# EasyEDA Pro project Midal-MIDI-Interface_2025-12-06.epro

# Schematic Core board

## Sheets
1 MC: Board Name: Core board; Create Date: 2025-09-05; Page Name: MC; Project Name: Midal MIDI Interface; Schematic Name: Core board; Update Date: 2025-10-09; Company: EasyEDA.com; Page Size: A4; Version: V1.0
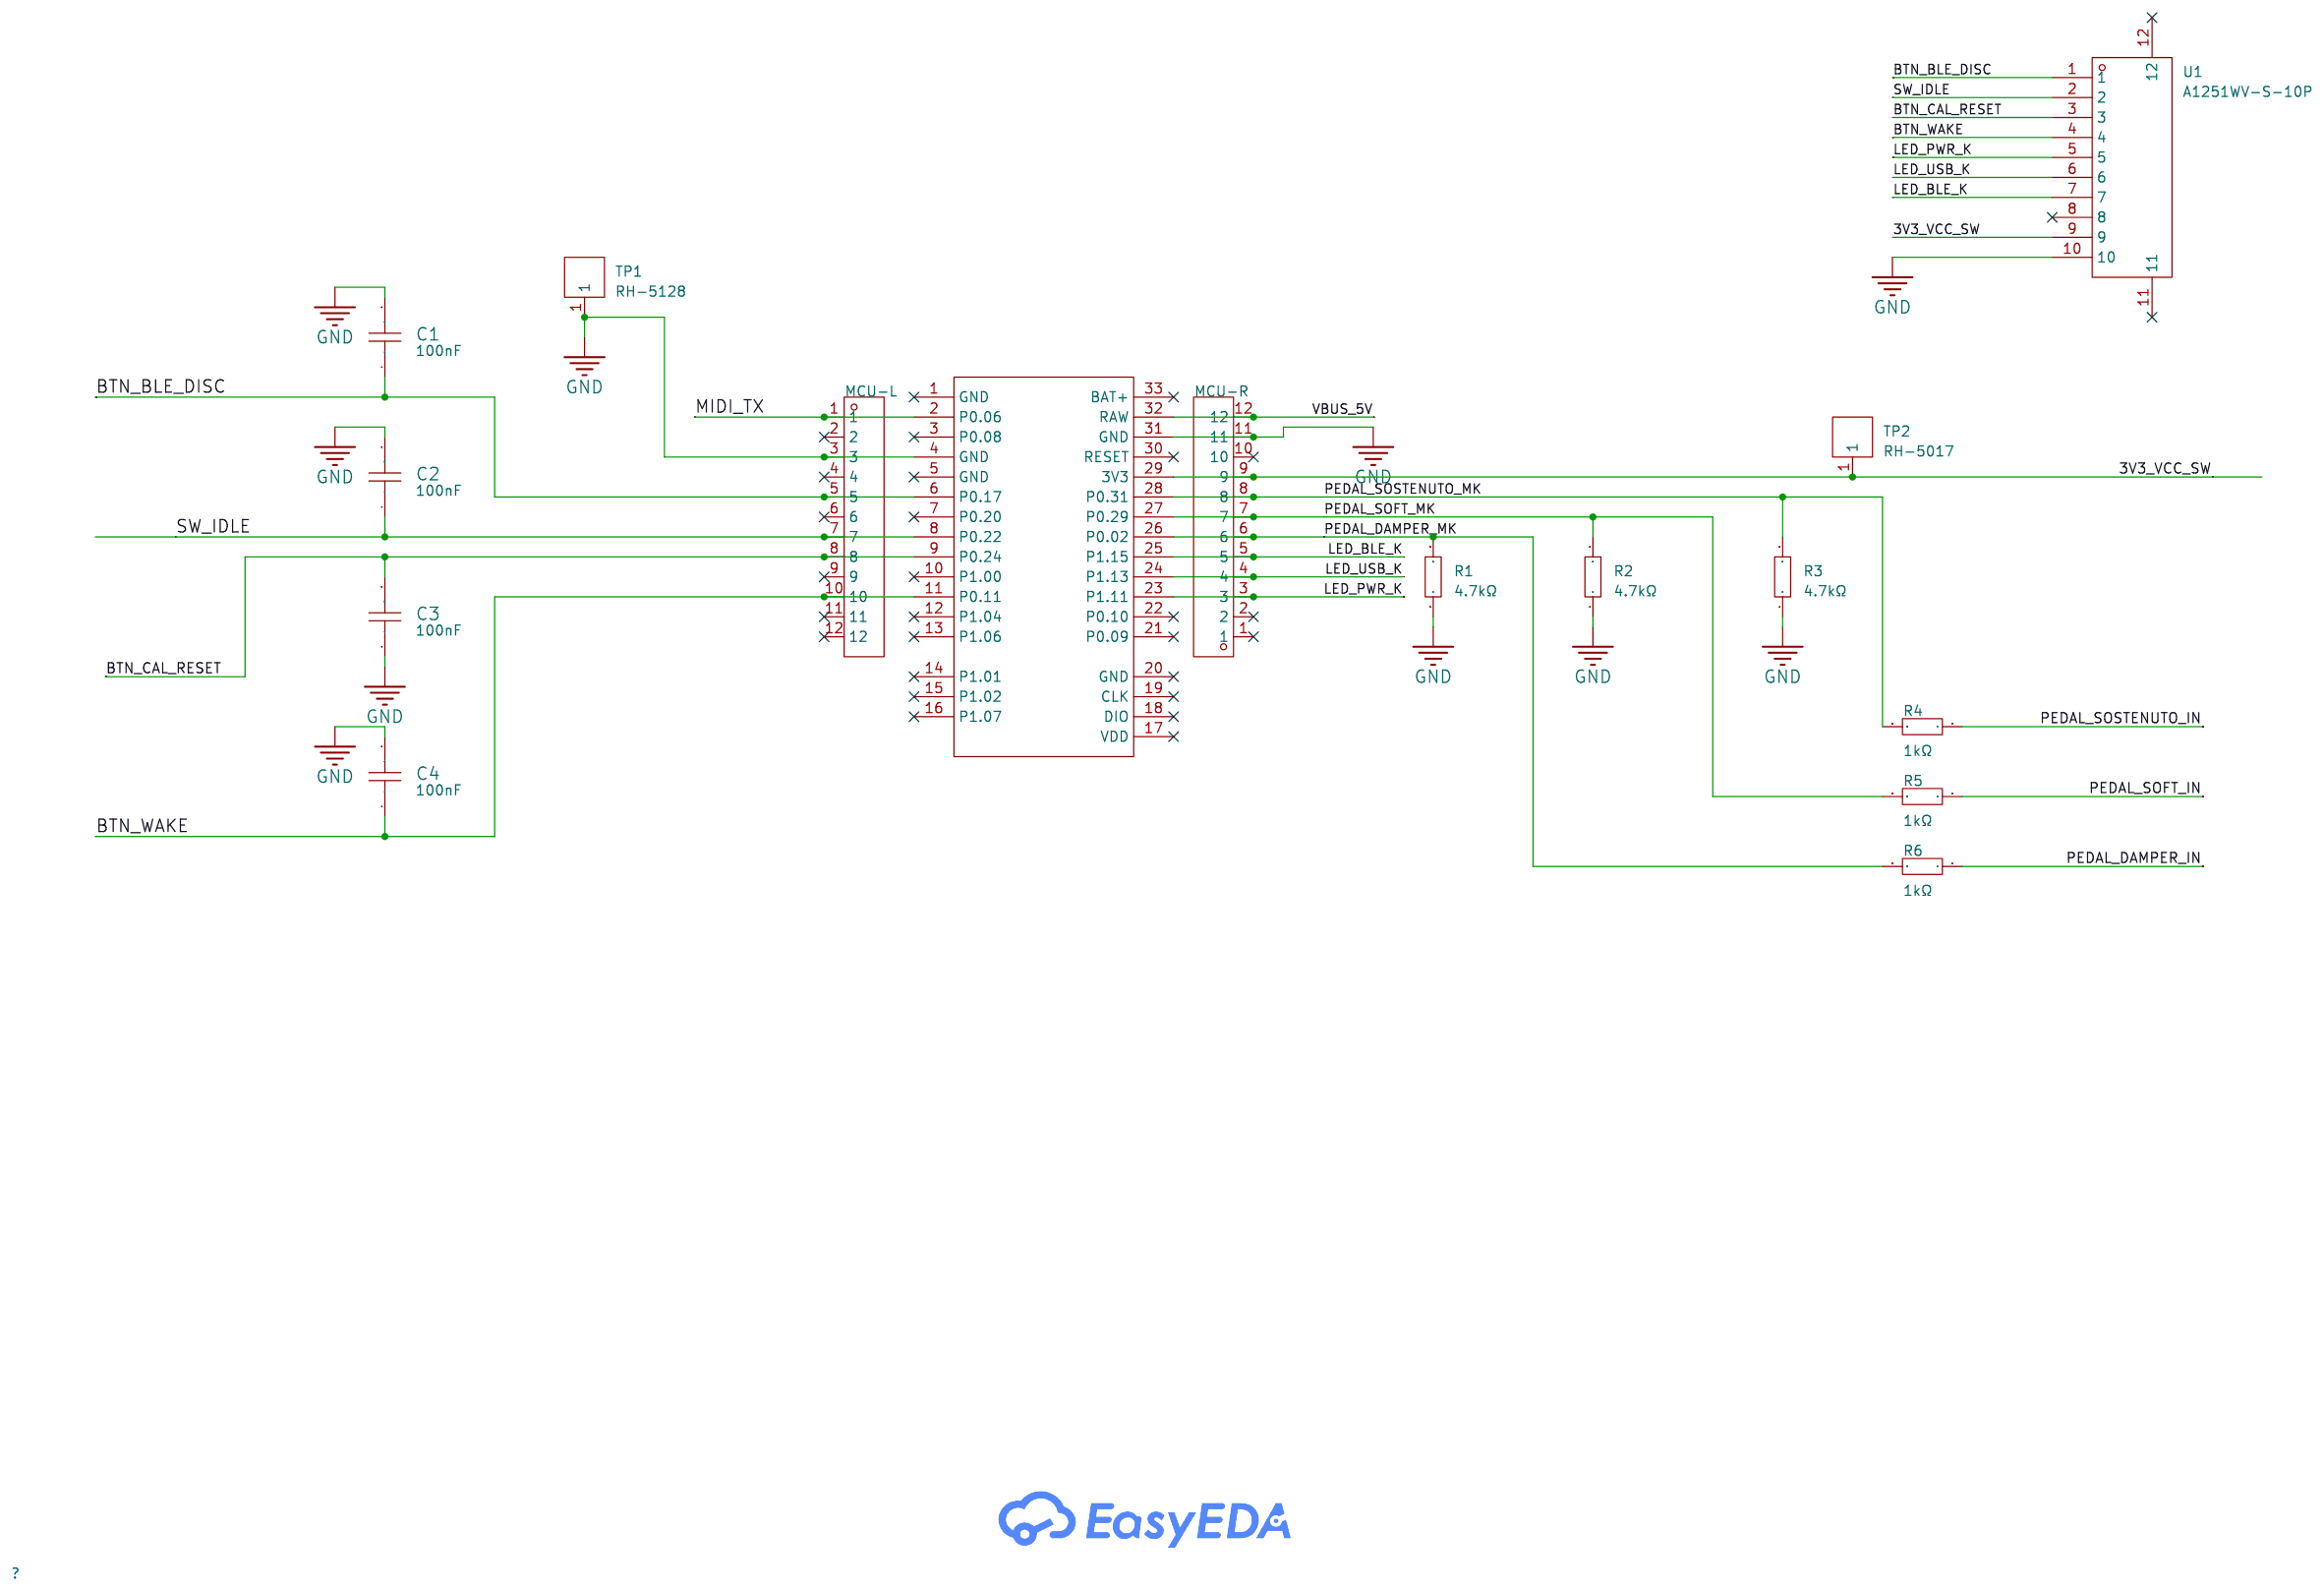
[diagram p0: MC]
2 PEDAL: Page Name: PEDAL; Update Date: 2025-10-07
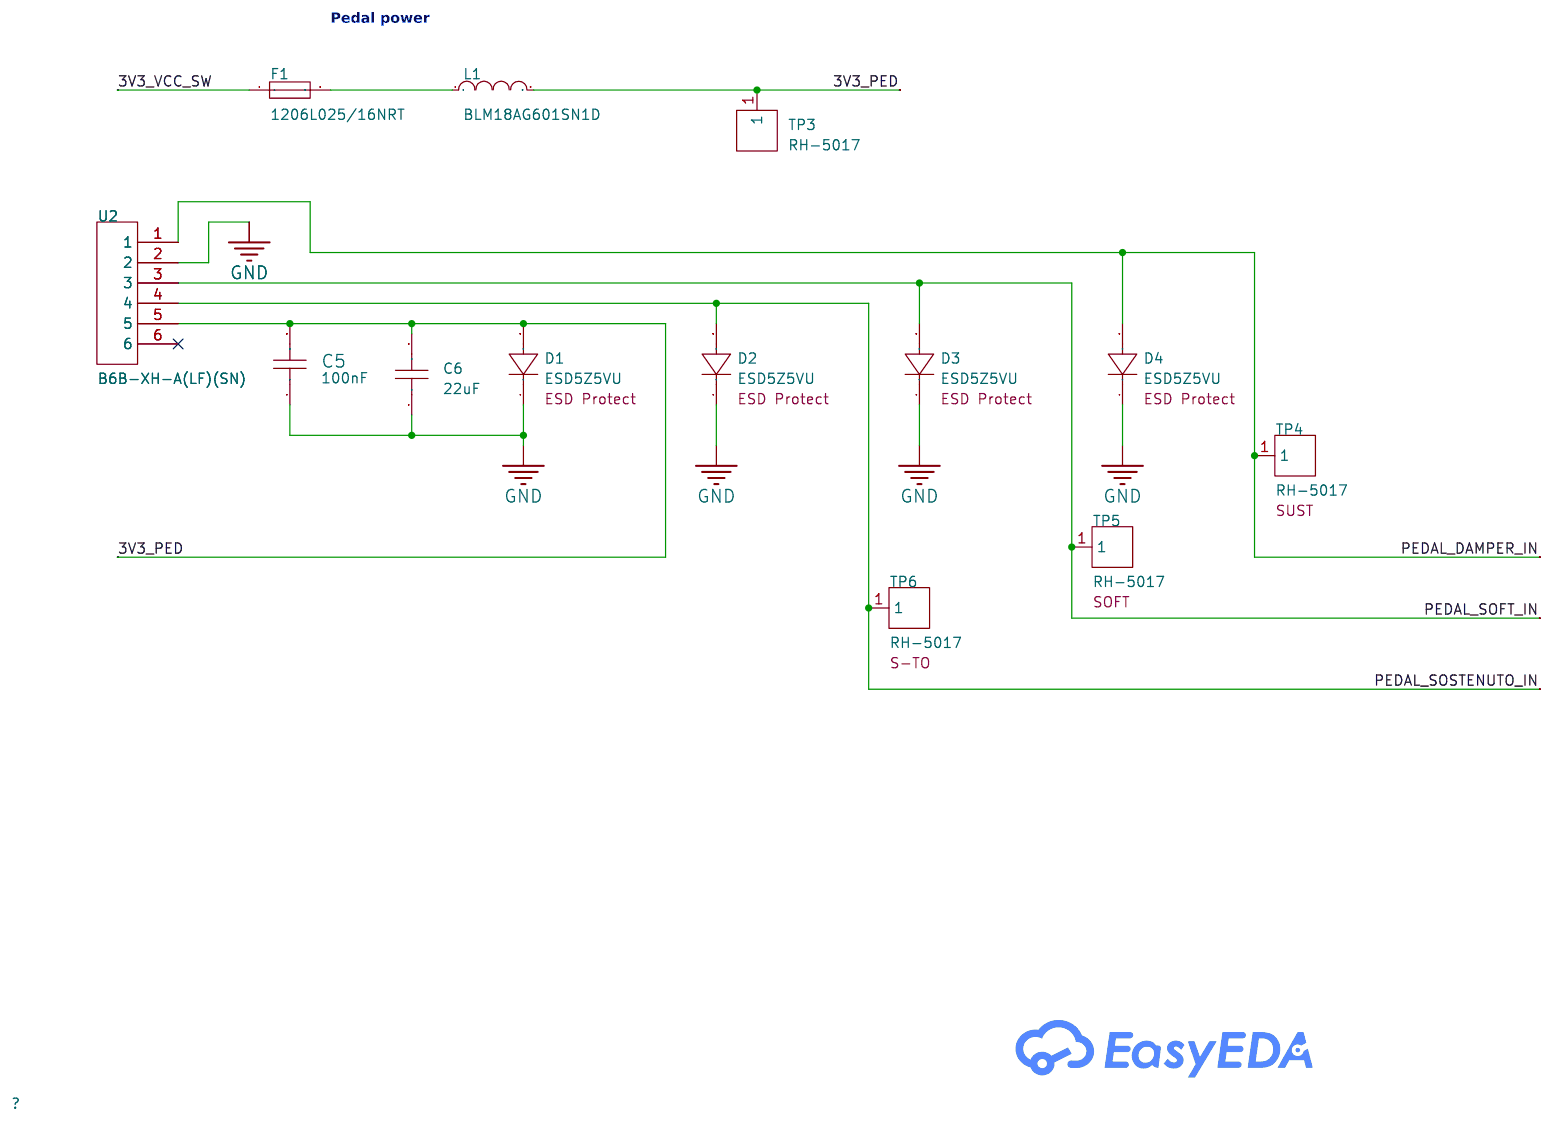
[diagram p1: PEDAL]
3 MIDI OUT: Page Name: MIDI OUT; Update Date: 2025-10-08
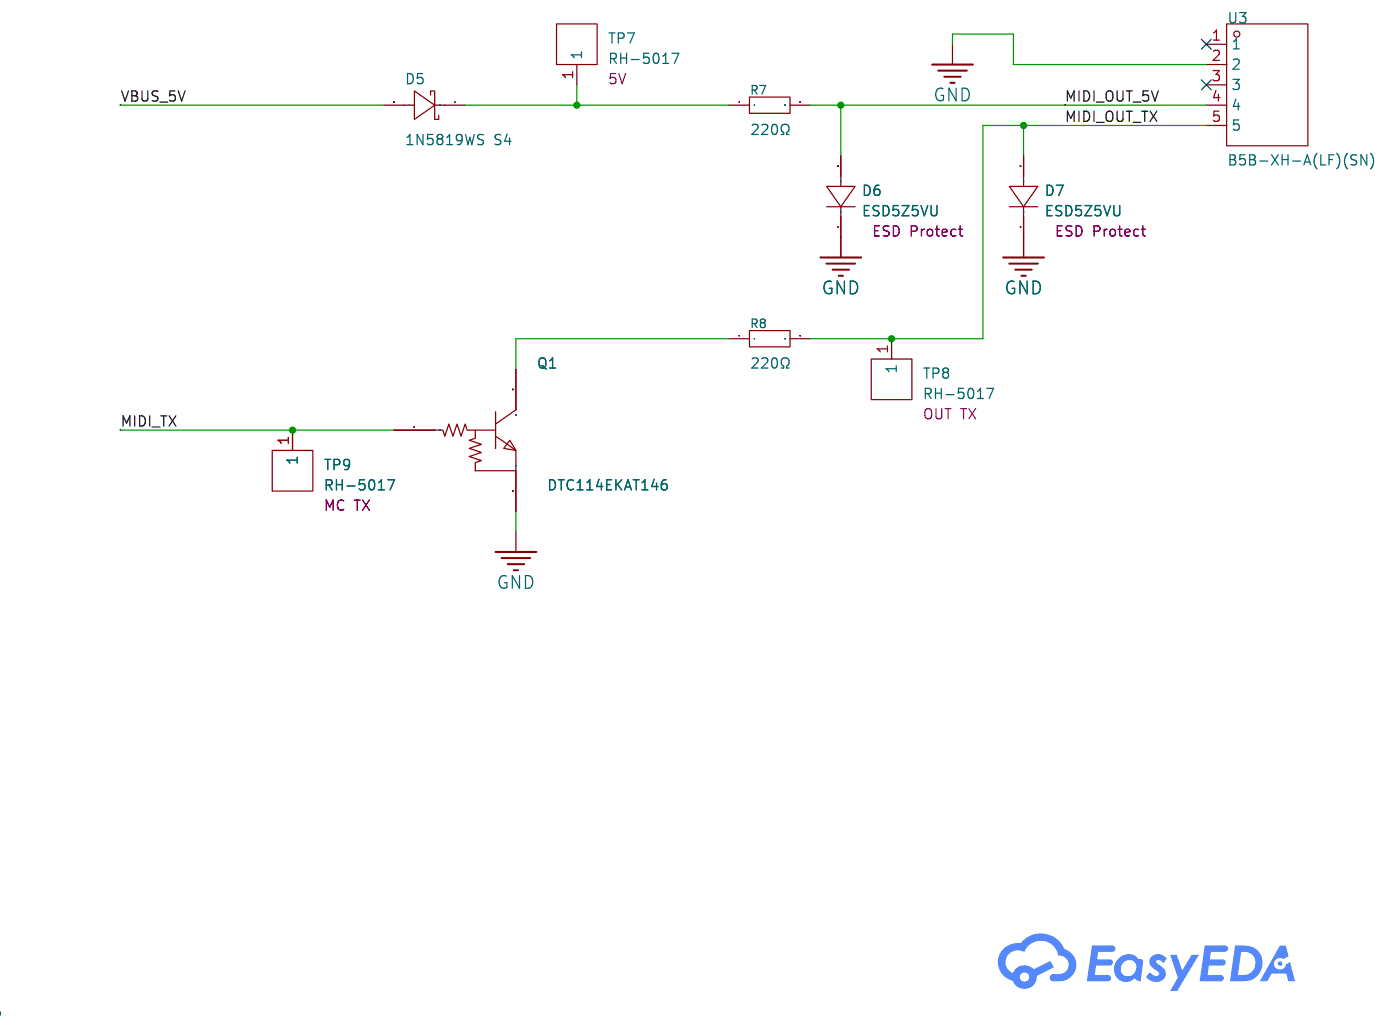
[diagram p2: MIDI OUT]

## Parts
sheet MC
C1  100nF  [C0603]
C2  100nF  [C0603]
C3  100nF  [C0603]
C4  100nF  [C0603]
MCU1  a04b0b1ddfb941d7a6903b0407237df4  [Pro Micro nRF52840]  (no BOM)
MCU-L  PM254-1-12-Z-3.0-C  [HDR-TH_12P-P2.54-V-F-3]
MCU-R  PM254-1-12-Z-3.0-C  [HDR-TH_12P-P2.54-V-F-3]
R1  4.7kΩ  [R0603]
R2  4.7kΩ  [R0603]
R3  4.7kΩ  [R0603]
R4  1kΩ  [R0603]
R5  1kΩ  [R0603]
R6  1kΩ  [R0603]
TP1  RH-5128  [TH_BD3.2-D2.0]
TP2  RH-5017  [SMD_L2.7-W1.0]  (no BOM)
U1  A1251WV-S-10P  [CONN-SMD_10P-P1.25_A1251WV-S-10P]
sheet MIDI OUT
D5  1N5819WS S4  [SOD-323_L1.6-W1.3-LS2.7-RD]
D6  ESD5Z5VU  [SOD-523_L1.2-W0.8-LS1.6-RD]
D7  ESD5Z5VU  [SOD-523_L1.2-W0.8-LS1.6-RD]
Q1  DTC114EKAT146  [SOT-346_L2.9-W1.6-P1.90-LS2.8-TR-CW]
R7  220Ω  [R0603]
R8  220Ω  [R0603]
TP7  RH-5017  [SMD_L2.7-W1.0]  (no BOM)
TP8  RH-5017  [SMD_L2.7-W1.0]  (no BOM)
TP9  RH-5017  [SMD_L2.7-W1.0]  (no BOM)
U3  B5B-XH-A(LF)(SN)  [CONN-TH_B5B-XH-A-LF-SN]
sheet PEDAL
C5  100nF  [C0603]
C6  22uF  [C1206]
D1  ESD5Z5VU  [SOD-523_L1.2-W0.8-LS1.6-RD]
D2  ESD5Z5VU  [SOD-523_L1.2-W0.8-LS1.6-RD]
D3  ESD5Z5VU  [SOD-523_L1.2-W0.8-LS1.6-RD]
D4  ESD5Z5VU  [SOD-523_L1.2-W0.8-LS1.6-RD]
F1  1206L025/16NRT  [F1206]
L1  BLM18AG601SN1D  [L0603]
TP3  RH-5017  [SMD_L2.7-W1.0]  (no BOM)
TP4  RH-5017  [SMD_L2.7-W1.0]  (no BOM)
TP5  RH-5017  [SMD_L2.7-W1.0]  (no BOM)
TP6  RH-5017  [SMD_L2.7-W1.0]  (no BOM)
U2  B6B-XH-A(LF)(SN)  [CONN-TH_6P-P2.50_B6B-XH-A-LF-SN]

## Library data of the parts
C1-C5 = CC0603KRX7R7BB104: Capacitance:100nF Tolerance:±10% Tolerance:±10% Voltage Rating:16V Temperature Coefficient:X7R; LCSC Part Name: 100nF ±10% 16V; Supplier Part: C108079; Manufacturer: YAGEO(国巨); Supplier Footprint: 0603; JLCPCB Part Class: Extended Part; Datasheet: https://item.szlcsc.com/datasheet/CC0603KRX7R7BB104/109298.html; Supplier: LCSC; Tolerance: ±10%; Voltage Rating: 16V; Temperature Coefficient: X7R; Standardization Check: true
MCU1 = Pro Micro nRF52840: For more information, please refer to: https://docs.nordicsemi.com/bundle/ncs-latest/page/zephyr/boards/others/promicro_nrf52840/doc/index.html; Check: false; Standardization Check: false
MCU-L MCU-R = PM254-1-12-Z-3.0-C MCU-R: Holes Structure:1x12P Pitch:2.54mm Row Spacing:- Circular Hole / Square Hole:Round Hole Mounting Type:Through Hole Number of Rows:1 Number of Positions:12P Current Rating:3A Voltage Rating (Max):- Holes Direction:Top Insulation Height:3mm Contact Material; Manufacturer: HCTL(华灿天禄); Supplier: LCSC; Supplier Part: C5156451; LCSC Part Name: 1x12P 间距:2.54mm 直插; Supplier Footprint: 插件,P=2.54mm; JLCPCB Part Class: Extended Part; Datasheet: https://item.szlcsc.com/datasheet/PM254-1-12-Z-3.0-C/5789334.html; Holes Structure: 1x12P; Pitch: 2.54mm; Circular Hole / Square Hole: Round Hole; Mounting Type: Through Hole; Number of Rows: 1; Number of Positions: 12P; Current Rating: 3A; Holes Direction: Top; Insulation Height: 3mm; Contact Material: Brass; Contact Plating: Gold; Operating Temperature: -40℃~+105℃
R1-R3 = 0603WAF4701T5E: Type:Thick Film Resistor Resistance:4.7kΩ Tolerance:±1% Tolerance:±1% Power(Watts):100mW Voltage-Supply(Max):75V Temperature Coefficient:±100ppm/℃ Temperature Coefficient:±100ppm/℃ Operating Temperature:-55℃~+155℃ Operating Temperature:-55℃~+155℃; LCSC Part Name: 4.7kΩ ±1% 100mW 厚膜电阻; Supplier Part: C23162; Manufacturer: UNI-ROYAL(厚声); Supplier Footprint: 0603; JLCPCB Part Class: Basic Part; Datasheet: https://item.szlcsc.com/datasheet/0603WAF4701T5E/23889.html; Supplier: LCSC; Type: Thick Film Resistor; Tolerance: ±1%; Power(Watts): 100mW; Voltage-Supply(Max): 75V; Temperature Coefficient: ±100ppm/℃; Operating Temperature: -55℃~+155℃; Standardization Check: true
R4-R6 = 0603WAF1001T5E: Type:Thick Film Resistors Resistance:1kΩ Tolerance:±1% Tolerance:±1% Power(Watts): Overload Voltage (Max): Temperature Coefficient:±100ppm/℃ Temperature Coefficient:±100ppm/℃ Operating Temperature Range:-55℃~+155℃ Operating Temperature Range:-55℃~+155℃; LCSC Part Name: 1kΩ ±1% 100mW 厚膜电阻; Supplier Part: C21190; Manufacturer: UNI-ROYAL(厚声); Supplier Footprint: 0603; JLCPCB Part Class: Basic Part; Datasheet: https://atta.szlcsc.com/upload/public/pdf/source/20200306/C422600_1E6D84923E4A46A82E41ADD87F860B5C.pdf; Supplier: LCSC; Type: Thick Film Resistors; Tolerance: ±1%; Temperature Coefficient: ±100ppm/℃; Operating Temperature Range: -55℃~+155℃; Check: true; Standardization Check: true
TP1 = RH-5128: Connector Type:Pin Type (Through-Board) Plastic Color:Gray Board Space (Diameter φ/ Length x Width):-; Supplier Part: C7589097; Manufacturer: 荣和; JLCPCB Part Class: Extended Part; Datasheet: https://atta.szlcsc.com/upload/public/pdf/source/20230901/3684C0D2C347269B17F6001F9B0842CE.pdf; Supplier: LCSC; Connector Type: Pin Type (Through-Board); Plastic Color: Gray; Check: true
TP2 TP3 = RH-5017: Connector Type:Ferrite Ring (SMD) Plastic Color:Non-Plastic Board Space (Diameter φ/ Length x Width):2.67mmx1.02mm; Supplier Part: C7589099; Manufacturer: 荣和; JLCPCB Part Class: Extended Part; Datasheet: https://atta.szlcsc.com/upload/public/pdf/source/20230906/4AE6B4758551C194F4231EAD7BFD3BA4.pdf; Supplier: LCSC; Connector Type: Ferrite Ring (SMD); Plastic Color: Non-Plastic; Board Space (Diameter φ/ Length x Width): 2.67mmx1.02mm; Check: true
U1 = A1251WV-S-10P: Pins Structure:1x10P Pitch:1.25mm Mounting Type:- Reference Series:- Number of Pins:10P Number of Rows:1 Number of PINs Per Row:10 Row Spacing:- Contact Material:Phosphor Bronze; LCSC Part Name: 间距:1.25mm 1x10P; Supplier Part: C273002; Manufacturer: CJT(长江连接器); Supplier Footprint: SMD,P=1.25mm; JLCPCB Part Class: Extended Part; Datasheet: https://item.szlcsc.com/datasheet/A1251WV-S-10P/261373.html; Supplier: LCSC; Pins Structure: 1x10P; Pitch: 1.25mm; Number of Pins: 10P; Number of Rows: 1; Number of PINs Per Row: 10; Contact Material: Phosphor Bronze; Check: true; Standardization Check: true
D5 = 1N5819WS S4_C2927280: Diode Configuration:Independent Voltage - Forward(Vf@If):600mV@200mA Voltage - DC Reverse(Vr):40V Current - Rectified:350mA Reverse Leakage Current (Ir):5uA@30V Non-Repetitive Peak Forward Surge Current:1.5A; LCSC Part Name: 电压:40V 电流:350mA; Supplier Part: C2927280; Manufacturer: JSMSEMI(杰盛微); Supplier Footprint: SOD-323; JLCPCB Part Class: Extended Part; Datasheet: https://item.szlcsc.com/datasheet/1N5819WS%2520S4/3253665.html; Supplier: LCSC; Diode Configuration: Independent; Voltage - Forward(Vf@If): 600mV@200mA; Voltage - DC Reverse(Vr): 40V; Current - Rectified: 350mA; Reverse Leakage Current (Ir): 5uA@30V; Non-Repetitive Peak Forward Surge Current: 1.5A; Check: true; Standardization Check: true
D1-D4 D6 D7 = ESD5Z5VU: ESD Protect; Supplier Part: C2901323; Manufacturer: TECH PUBLIC(台舟); Supplier Footprint: SOD-523; JLCPCB Part Class: Extended Part; Datasheet: https://atta.szlcsc.com/upload/public/pdf/source/20210926/2866639A72B5F52D9A6EB2B69A0D9327.pdf; Supplier: LCSC; Check: true; Standardization Check: true
Q1 = DTC114EKAT146: Number:- Collector - Emitter Voltage VCEO:50V Current - Collector(Ic):100mA Pd - Power Dissipation:200mW DC Current Gain:30@5mA,5V Input Voltage (VI(on)@Ic,Vce):3V@10mA,0.3V Voltage - Input(Max)(VI(off)):500mV@100uA,5V Input Resistor:10kΩ Resistor Ratio:1; LCSC Part Name: NPN型，100mA、50V数字晶体管; Supplier Part: C79971; Manufacturer: ROHM(罗姆); Supplier Footprint: TO-236-3(SOT-23-3); JLCPCB Part Class: Extended Part; Datasheet: https://item.szlcsc.com/datasheet/DTC114EKAT146/81116.html; Supplier: LCSC; Collector - Emitter Voltage VCEO: 50V; Current - Collector(Ic): 100mA; Pd - Power Dissipation: 200mW; DC Current Gain: 30@5mA,5V; Input Voltage (VI(on)@Ic,Vce): 3V@10mA,0.3V; Voltage - Input(Max)(VI(off)): 500mV@100uA,5V; Input Resistor: 10kΩ; Resistor Ratio: 1; Check: true; Standardization Check: true
R7 R8 = 0603WAF2200T5E: Type:Thick Film Resistors Resistance: Tolerance:±1% Tolerance:±1% Power(Watts): Overload Voltage (Max): Temperature Coefficient:±100ppm/℃ Temperature Coefficient:±100ppm/℃ Operating Temperature Range:-55℃~+155℃ Operating Temperature Range:-55℃~+155℃; LCSC Part Name: 220Ω ±1% 100mW 厚膜电阻; Supplier Part: C22962; Manufacturer: UNI-ROYAL(厚声); Supplier Footprint: 0603; JLCPCB Part Class: Basic Part; Datasheet: https://atta.szlcsc.com/upload/public/pdf/source/20200306/C422600_1E6D84923E4A46A82E41ADD87F860B5C.pdf; Supplier: LCSC; Type: Thick Film Resistors; Tolerance: ±1%; Temperature Coefficient: ±100ppm/℃; Operating Temperature Range: -55℃~+155℃; Standardization Check: true
TP7 = RH-5017: Connector Type:Ferrite Ring (SMD) Plastic Color:Non-Plastic Board Space (Diameter φ/ Length x Width):2.67mmx1.02mm; Supplier Part: C7589099; Manufacturer: 荣和; JLCPCB Part Class: Extended Part; Datasheet: https://atta.szlcsc.com/upload/public/pdf/source/20230906/4AE6B4758551C194F4231EAD7BFD3BA4.pdf; Supplier: LCSC; Connector Type: Ferrite Ring (SMD); Plastic Color: Non-Plastic; Board Space (Diameter φ/ Length x Width): 2.67mmx1.02mm; Check: true; Comment: 5V
TP8 = RH-5017: Connector Type:Ferrite Ring (SMD) Plastic Color:Non-Plastic Board Space (Diameter φ/ Length x Width):2.67mmx1.02mm; Supplier Part: C7589099; Manufacturer: 荣和; JLCPCB Part Class: Extended Part; Datasheet: https://atta.szlcsc.com/upload/public/pdf/source/20230906/4AE6B4758551C194F4231EAD7BFD3BA4.pdf; Supplier: LCSC; Connector Type: Ferrite Ring (SMD); Plastic Color: Non-Plastic; Board Space (Diameter φ/ Length x Width): 2.67mmx1.02mm; Check: true; Comment: OUT TX
TP9 = RH-5017: Connector Type:Ferrite Ring (SMD) Plastic Color:Non-Plastic Board Space (Diameter φ/ Length x Width):2.67mmx1.02mm; Supplier Part: C7589099; Manufacturer: 荣和; JLCPCB Part Class: Extended Part; Datasheet: https://atta.szlcsc.com/upload/public/pdf/source/20230906/4AE6B4758551C194F4231EAD7BFD3BA4.pdf; Supplier: LCSC; Connector Type: Ferrite Ring (SMD); Plastic Color: Non-Plastic; Board Space (Diameter φ/ Length x Width): 2.67mmx1.02mm; Check: true; Comment: MC TX
U3 = B5B-XH-A(LF)(SN): Pins Structure:1x5P Pitch:2.5mm Mounting Type:Through Hole Reference Series:XH Number of Pins:5P Number of Rows:1 Number of PINs Per Row:5 Row Spacing:- Current Rating:3A Contact Material:Brass Contact Plating:Tin Operating Temperature:-25℃~+85℃ Operating; LCSC Part Name: 1x5P 间距:2.5mm 直插 系列:XH; Supplier Part: C157991; Manufacturer: JST; Supplier Footprint: 插件,P=2.5mm; JLCPCB Part Class: Extended Part; Datasheet: https://item.szlcsc.com/datasheet/B5B-XH-A(LF)(SN)/169339.html; Supplier: LCSC; Pins Structure: 1x5P; Pitch: 2.5mm; Mounting Type: Through Hole; Reference Series: XH; Number of Pins: 5P; Number of Rows: 1; Number of PINs Per Row: 5; Current Rating: 3A; Contact Material: Brass; Contact Plating: Tin; Operating Temperature: -25℃~+85℃; Voltage Rating: 250V; Plastic Material: PA66; Flame Retardant Rating: UL94V-0; Supplementary Features: K Pin; Color: White; Z-Height of the Board: 7mm; X-Length of Bottom Edge on Board (Spacing Line): 14.9mm; Y-Width of Bottom Edge on Board: 5.75mm; Standardization Check: true
C6 = HGC1206R7226K160NSPJ: Capacitance:22uF Tolerance:±10% Tolerance:±10% Voltage Rating:16V Temperature Coefficient:X7R; LCSC Part Name: 22uF ±10% 16V; Supplier Part: C7472972; Manufacturer: Chinocera(华瓷); Supplier Footprint: 1206; JLCPCB Part Class: Extended Part; Datasheet: https://item.szlcsc.com/datasheet/HGC1206R7226K160NSPJ/8532819.html; Supplier: LCSC; Tolerance: ±10%; Voltage Rating: 16V; Temperature Coefficient: X7R; Standardization Check: true
F1 = 1206L025/16NRT: Voltage - Max:16V Current - Max:50A Hold Current:250mA Trip Current:700mA Power Dissipation:1W Resistance - Initial (Ri) (Min):180mΩ Resistance - Post Trip (R1) (Max):2Ω Time to Trip(Max):100ms Operating Temperature:-40℃~+125℃ Operating Temperature:-40℃~+; LCSC Part Name: 16V 0.25A 1206 耐高温自恢复; Supplier Part: C28326714; Manufacturer: LUTE(陆特); Supplier Footprint: 1206; JLCPCB Part Class: Extended Part; Datasheet: https://item.szlcsc.com/datasheet/1206L025%252F16NRT/30063190.html; Supplier: LCSC; Voltage - Max: 16V; Current - Max: 50A; Hold Current: 250mA; Trip Current: 700mA; Power Dissipation: 1W; Resistance - Initial (Ri) (Min): 180mΩ; Resistance - Post Trip (R1) (Max): 2Ω; Time to Trip(Max): 100ms; Operating Temperature: -40℃~+125℃; Check: true; Standardization Check: true
L1 = BLM18AG601SN1D: Impedance @ Frequency:600Ω@100MHz Tolerance:±25% Tolerance:±25% DC Resistance(DCR):380mΩ Current Rating:500mA Number of Circuits:1 Operating Temperature:-55℃~+125℃ Operating Temperature:-55℃~+125℃; LCSC Part Name: 单路 0603磁珠 阻抗600Ω@100MHz; Supplier Part: C19330; Manufacturer: muRata(村田); Supplier Footprint: 0603; JLCPCB Part Class: Extended Part; Datasheet: https://item.szlcsc.com/datasheet/BLM18AG601SN1D/20038.html; Supplier: LCSC; Impedance @ Frequency: 600Ω@100MHz; Tolerance: ±25%; DC Resistance(DCR): 380mΩ; Current Rating: 500mA; Number of Circuits: 1; Operating Temperature: -55℃~+125℃; Check: true; Standardization Check: true
TP4 = RH-5017: Connector Type:Ferrite Ring (SMD) Plastic Color:Non-Plastic Board Space (Diameter φ/ Length x Width):2.67mmx1.02mm; Supplier Part: C7589099; Manufacturer: 荣和; JLCPCB Part Class: Extended Part; Datasheet: https://atta.szlcsc.com/upload/public/pdf/source/20230906/4AE6B4758551C194F4231EAD7BFD3BA4.pdf; Supplier: LCSC; Connector Type: Ferrite Ring (SMD); Plastic Color: Non-Plastic; Board Space (Diameter φ/ Length x Width): 2.67mmx1.02mm; Check: true; Comment: SUST
TP5 = RH-5017: Connector Type:Ferrite Ring (SMD) Plastic Color:Non-Plastic Board Space (Diameter φ/ Length x Width):2.67mmx1.02mm; Supplier Part: C7589099; Manufacturer: 荣和; JLCPCB Part Class: Extended Part; Datasheet: https://atta.szlcsc.com/upload/public/pdf/source/20230906/4AE6B4758551C194F4231EAD7BFD3BA4.pdf; Supplier: LCSC; Connector Type: Ferrite Ring (SMD); Plastic Color: Non-Plastic; Board Space (Diameter φ/ Length x Width): 2.67mmx1.02mm; Check: true; Comment: SOFT
TP6 = RH-5017: Connector Type:Ferrite Ring (SMD) Plastic Color:Non-Plastic Board Space (Diameter φ/ Length x Width):2.67mmx1.02mm; Supplier Part: C7589099; Manufacturer: 荣和; JLCPCB Part Class: Extended Part; Datasheet: https://atta.szlcsc.com/upload/public/pdf/source/20230906/4AE6B4758551C194F4231EAD7BFD3BA4.pdf; Supplier: LCSC; Connector Type: Ferrite Ring (SMD); Plastic Color: Non-Plastic; Board Space (Diameter φ/ Length x Width): 2.67mmx1.02mm; Check: true; Comment: S-TO
U2 = B6B-XH-A(LF)(SN): Pins Structure:1x6P Pitch:2.5mm Mounting Style:Direct Insert Reference Series:XH Number of Pins:6P Number of Rows:1 Number of PINs Per Row:6 Row Spacing:- Current Rating (Max):3A Contact Material:Brass Contact Plating:Tin Operating Temperature Range:-25℃~; LCSC Part Name: 1x6P 间距:2.5mm 直插 系列:XH; Supplier Part: C144397; Manufacturer: JST; Supplier Footprint: 插件,P=2.5mm; JLCPCB Part Class: Extended Part; Datasheet: https://atta.szlcsc.com/upload/public/pdf/source/20180928/C265283_F9DFEEBDB2CF642B6BDFAB4B77BD2680.pdf; Supplier: LCSC; Pins Structure: 1x6P; Pitch: 2.5mm; Mounting Style: Direct Insert; Reference Series: XH; Number of Pins: 6P; Number of Rows: 1; Number of PINs Per Row: 6; Current Rating (Max): 3A; Contact Material: Brass; Contact Plating: Tin; Operating Temperature Range: -25℃~+85℃; Rated Voltage (Max): 250V; Plastic Material: PA66; Flame Retardant Rating: UL94V-0; Supplementary Features: K-leg punch; Colour: White; Z-Height of the Board: 7mm; X-Length of Bottom Edge on Board (Spacing Line): 17.4mm; Y-Width of Bottom Edge on Board: 5.75mm; Standardization Check: true

## Nets
3V3_PED: C5.2 C6.2 D1.2(A) L1.2 TP3.1 U2.5
3V3_VCC_SW: F1.1 MCU1.29(3V3) MCU-R.9 TP2.1 U1.9
GND: C1.2 C2.2 C3.1 C4.2 C5.1 C6.1 D1.1(K) D2.1(K) D3.1(K) D4.1(K) D6.1(K) D7.1(K) MCU1.4(GND) MCU1.31(GND) MCU-L.3 MCU-R.11 Q1.1(E) R1.1 R2.1 R3.1 TP1.1 U1.10 U2.2 U3.2
VBUS_5V: D5.2(A) MCU1.32(RAW) MCU-R.12
VBUS_5V_PROT: D5.1(C) R7.1 TP7.1
BTN_BLE_DISC: C1.1 MCU1.6(P0.17) MCU-L.5 U1.1
BTN_CAL_RESET: C3.2 MCU1.9(P0.24) MCU-L.8 U1.3
BTN_WAKE: C4.1 MCU1.11(P0.11) MCU-L.10 U1.4
LED_BLE_K: MCU1.25(P1.15) MCU-R.5 U1.7
LED_PWR_K: MCU1.23(P1.11) MCU-R.3 U1.5
LED_USB_K: MCU1.24(P1.13) MCU-R.4 U1.6
MIDI_OUT_5V: D6.2(A) R7.2 U3.4
MIDI_OUT_TX: D7.2(A) R8.2 TP8.1 U3.5
MIDI_TX: MCU1.2(P0.06) MCU-L.1 Q1.2(B) TP9.1
MIDI_TX_UNPROT: Q1.3(C) R8.1
PEDAL_DAMPER_IN: D4.2(A) R6.1 TP4.1 U2.1
PEDAL_DAMPER_MK: MCU1.26(P0.02) MCU-R.6 R1.2 R6.2
PEDAL_SOFT_IN: D3.2(A) R5.1 TP5.1 U2.3
PEDAL_SOFT_MK: MCU1.27(P0.29) MCU-R.7 R2.2 R5.2
PEDAL_SOSTENUTO_IN: D2.2(A) R4.1 TP6.1 U2.4
PEDAL_SOSTENUTO_MK: MCU1.28(P0.31) MCU-R.8 R3.2 R4.2
SW_IDLE: C2.1 MCU1.8(P0.22) MCU-L.7 U1.2
$2N438: F1.2 L1.1

Not connected (* = marked no-connect by the designer): MCU1 1(GND)* 3(P0.08)* 5(GND)* 7(P0.20)* 10(P1.00)* 12(P1.04)* 13(P1.06)* 14(P1.01)* 15(P1.02)* 16(P1.07)* 17(VDD)* 18(DIO)* 19(CLK)* 20(GND)* 21(P0.09)* 22(P0.10)* 30(RESET)* 33(BAT+)*; MCU-L 2* 4* 6* 9* 11* 12*; MCU-R 1* 2* 10*; U1 8* 11* 12*; U2 6*; U3 1* 3*

## Notes on the sheets
sheet 2
- Pedal power

# Schematic Indication
Board Name: Indication; Create Date: 2025-09-07; Page Name: Indication; Project Name: Midal MIDI Interface; Schematic Name: Indication; Update Date: 2025-10-07; Company: EasyEDA.com; Page Size: A4; Version: V1.0
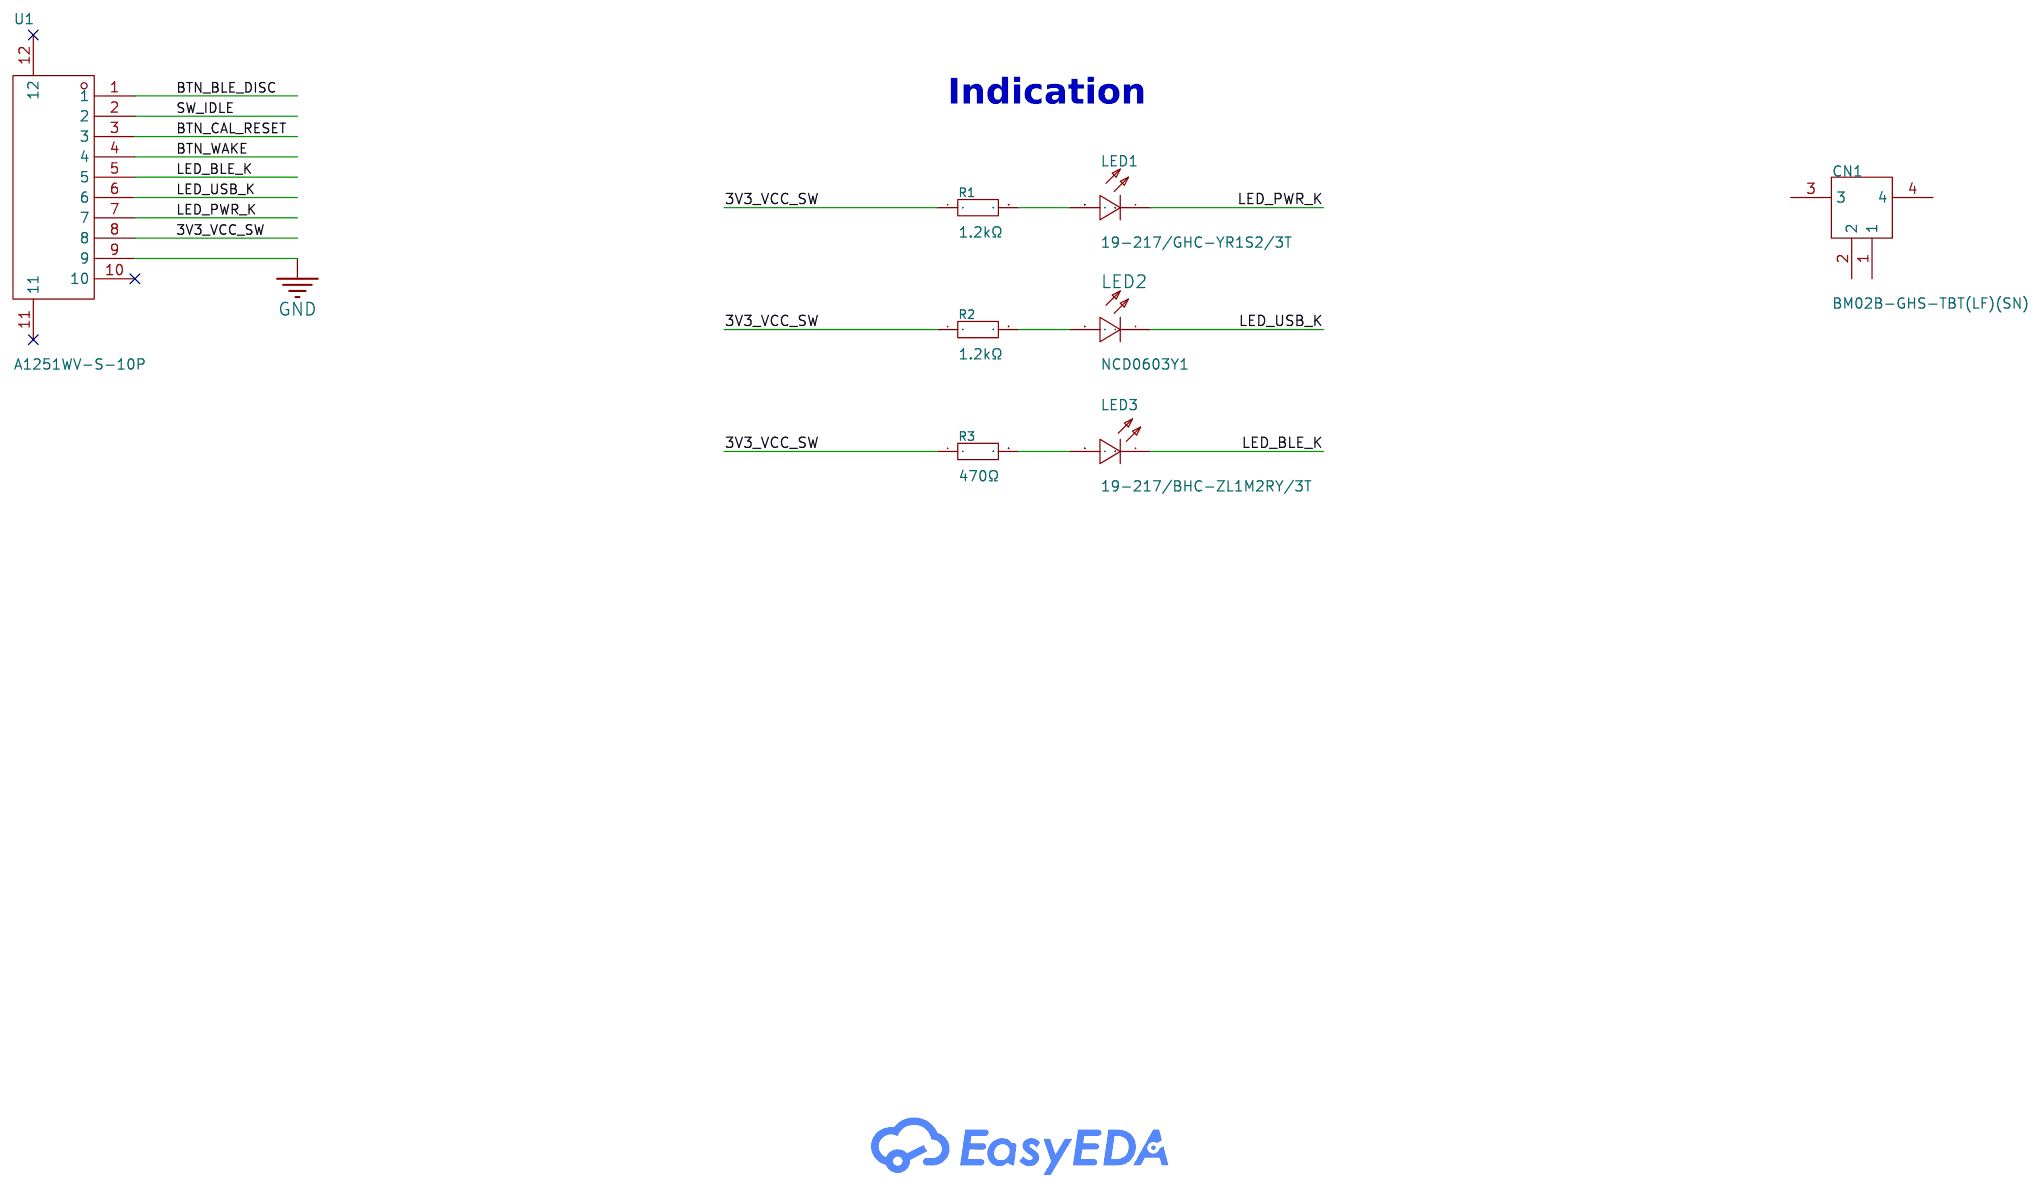
[diagram p3: schematic sheet]

## Parts
CN1  BM02B-GHS-TBT(LF)(SN)  [CONN-SMD_2P-P1.25_BM02B-GHS-TBT-LF-SN]
LED1  19-217/GHC-YR1S2/3T  [LED0603-RD]
LED2  NCD0603Y1  [LED0603-RD]
LED3  19-217/BHC-ZL1M2RY/3T  [LED0603-FD_BLUE]
R1  1.2kΩ  [R0805]
R2  1.2kΩ  [R0805]
R3  470Ω  [R0805]
U1  A1251WV-S-10P  [CONN-SMD_10P-P1.25_A1251WV-S-10P]

## Library data of the parts
CN1 = BM02B-GHS-TBT(LF)(SN)_C161690: Pins Structure:1x2P Pitch:1.25mm Mounting Style:Standing paste Reference Series:GH Number of Pins:2P Number of Rows:1 Number of PINs Per Row:2 Row Spacing:- Current Rating (Max):1A Contact Material:Phosphor Bronze Contact Plating:Tin Operating Temperature; LCSC Part Name: 1x2P 间距:1.25mm 立贴 系列:GH; Supplier Part: C161690; Manufacturer: JST; Supplier Footprint: SMD,P=1.25mm; JLCPCB Part Class: Extended Part; Datasheet: https://atta.szlcsc.com/upload/public/pdf/source/20181009/C265379_627E5111B25906DAAB327E382701D435.pdf; Supplier: LCSC; Pins Structure: 1x2P; Pitch: 1.25mm; Mounting Style: Standing paste; Reference Series: GH; Number of Pins: 2P; Number of Rows: 1; Number of PINs Per Row: 2; Current Rating (Max): 1A; Contact Material: Phosphor Bronze; Contact Plating: Tin; Operating Temperature Range: -25℃~+85℃; Rated Voltage (Max): 50V; Plastic Material: PA9T; Flame Retardant Rating: UL94V-0; Supplementary Features: Auxiliary soldering legs; Colour: White; Z-Height of the Board: 4.05mm; X-Length of Bottom Edge on Board (Spacing Line): 5.75mm; Y-Width of Bottom Edge on Board: 4.32mm; Check: true
LED1 = 19-217/GHC-YR1S2/3T: Illumination Color:Emerald Green Voltage - Forward(Vf):3.3V Voltage - Forward(Vf):3.3V Power(Watts):110mW Forward Current:20mA Wavelength - Dominant:520nm~535nm Wavelength - Dominant:520nm~535nm Peak Wavelength:518nm Diode Configuration:- Lens Color:Water; LCSC Part Name: 翠绿 停产; Supplier Part: C72043; Manufacturer: EVERLIGHT(亿光); Supplier Footprint: 0603; JLCPCB Part Class: Extended Part; Supplier: LCSC; Illumination Color: Emerald Green; Voltage - Forward(Vf): 3.3V; Power(Watts): 110mW; Forward Current: 20mA; Wavelength - Dominant: 520nm~535nm; Peak Wavelength: 518nm; Lens Color: Water Clear; Luminous Intensity: 199mcd; Viewing Angle: 120°; Operating Temperature: -40℃~+85℃
LED2 = NCD0603Y1: Illumination Color:Yellow Voltage - Forward(Vf):1.6V~2.6V Voltage - Forward(Vf):1.6V~2.6V Power(Watts):65mW Forward Current:25mA Wavelength - Dominant:586nm~595nm Wavelength - Dominant:586nm~595nm Peak Wavelength:595nm Lens Color:- Luminous Intensity:220m; LCSC Part Name: 片式发光二极管; Supplier Part: C84268; Manufacturer: 国星光电; Supplier Footprint: 0603; JLCPCB Part Class: Extended Part; Datasheet: https://item.szlcsc.com/datasheet/NCD0603Y1/85437.html; Supplier: LCSC; Illumination Color: Yellow; Voltage - Forward(Vf): 1.6V~2.6V; Power(Watts): 65mW; Forward Current: 25mA; Wavelength - Dominant: 586nm~595nm; Peak Wavelength: 595nm; Luminous Intensity: 220mcd; Viewing Angle: 130°; Operating Temperature: -30℃~+85℃
LED3 = 19-217/BHC-ZL1M2RY/3T: Illumination Color:Blue Power(Watts):110mW Forward Current:5mA Wavelength - Dominant:465nm~475nm Wavelength - Dominant:465nm~475nm Peak Wavelength:468nm Diode Configuration:- Lens Color:Water Clear Color Temperature:- Color Temperature:- Viewing Angle:120; LCSC Part Name: 停产 蓝灯; Supplier Part: C72041; Manufacturer: EVERLIGHT(亿光); Supplier Footprint: 0603; JLCPCB Part Class: Extended Part; Supplier: LCSC; Illumination Color: Blue; Power(Watts): 110mW; Forward Current: 5mA; Wavelength - Dominant: 465nm~475nm; Peak Wavelength: 468nm; Lens Color: Water Clear; Viewing Angle: 120°; Operating Temperature: -40℃~+85℃
R1 R2 = 0805W8F1201T5E: Type:Thick Film Resistor Resistance:1.2kΩ Tolerance:±1% Tolerance:±1% Power(Watts):125mW Voltage-Supply(Max):150V Temperature Coefficient:±100ppm/℃ Temperature Coefficient:±100ppm/℃ Operating Temperature:-55℃~+155℃ Operating Temperature:-55℃~+155℃; LCSC Part Name: 1.2kΩ ±1% 125mW 厚膜电阻; Supplier Part: C17379; Manufacturer: UNI-ROYAL(厚声); Supplier Footprint: 0805; JLCPCB Part Class: Basic Part; Datasheet: https://item.szlcsc.com/datasheet/0805W8F1201T5E/18067.html; Supplier: LCSC; Type: Thick Film Resistor; Tolerance: ±1%; Power(Watts): 125mW; Voltage-Supply(Max): 150V; Temperature Coefficient: ±100ppm/℃; Operating Temperature: -55℃~+155℃
R3 = 0805W8F4700T5E: Type:Thick Film Resistor Resistance:470Ω Tolerance:±1% Tolerance:±1% Power(Watts):125mW Voltage-Supply(Max):150V Temperature Coefficient:±100ppm/℃ Temperature Coefficient:±100ppm/℃ Operating Temperature:-55℃~+155℃ Operating Temperature:-55℃~+155℃; LCSC Part Name: 470Ω ±1% 125mW 厚膜电阻; Supplier Part: C17710; Manufacturer: UNI-ROYAL(厚声); Supplier Footprint: 0805; JLCPCB Part Class: Basic Part; Datasheet: https://item.szlcsc.com/datasheet/0805W8F4700T5E/18398.html; Supplier: LCSC; Type: Thick Film Resistor; Tolerance: ±1%; Power(Watts): 125mW; Voltage-Supply(Max): 150V; Temperature Coefficient: ±100ppm/℃; Operating Temperature: -55℃~+155℃
U1 = A1251WV-S-10P: Pins Structure:1x10P Pitch:1.25mm Mounting Type:- Reference Series:- Number of Pins:10P Number of Rows:1 Number of PINs Per Row:10 Row Spacing:- Contact Material:Phosphor Bronze; LCSC Part Name: 间距:1.25mm 1x10P; Supplier Part: C273002; Manufacturer: CJT(长江连接器); Supplier Footprint: SMD,P=1.25mm; JLCPCB Part Class: Extended Part; Datasheet: https://item.szlcsc.com/datasheet/A1251WV-S-10P/261373.html; Supplier: LCSC; Pins Structure: 1x10P; Pitch: 1.25mm; Number of Pins: 10P; Number of Rows: 1; Number of PINs Per Row: 10; Contact Material: Phosphor Bronze; Check: true

## Nets
3V3_VCC_SW: R1.1 R2.1 R3.1 U1.8
GND: U1.9
BTN_BLE_DISC: U1.1
BTN_CAL_RESET: U1.3
BTN_WAKE: U1.4
LED_BLE_K: LED3.1(C) U1.5
LED_PWR_K: LED1.1(C) U1.7
LED_USB_K: LED2.1(K) U1.6
SW_IDLE: U1.2
Net-(LED1-2): LED1.2(A) R1.2
Net-(LED2-2): LED2.2(A) R2.2
Net-(LED3-2): LED3.2(A) R3.2

Not connected (* = marked no-connect by the designer): CN1 1 2 3 4; U1 10* 11* 12*

## Notes on the sheet
- Indication

# Board Core board
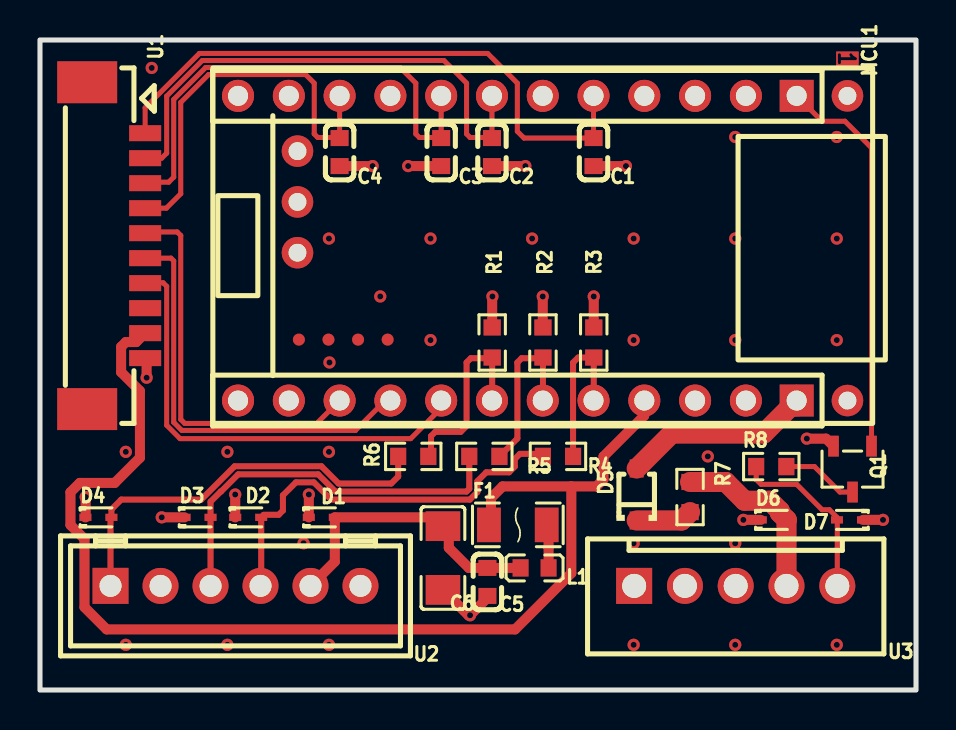
[diagram p4: board, top side]
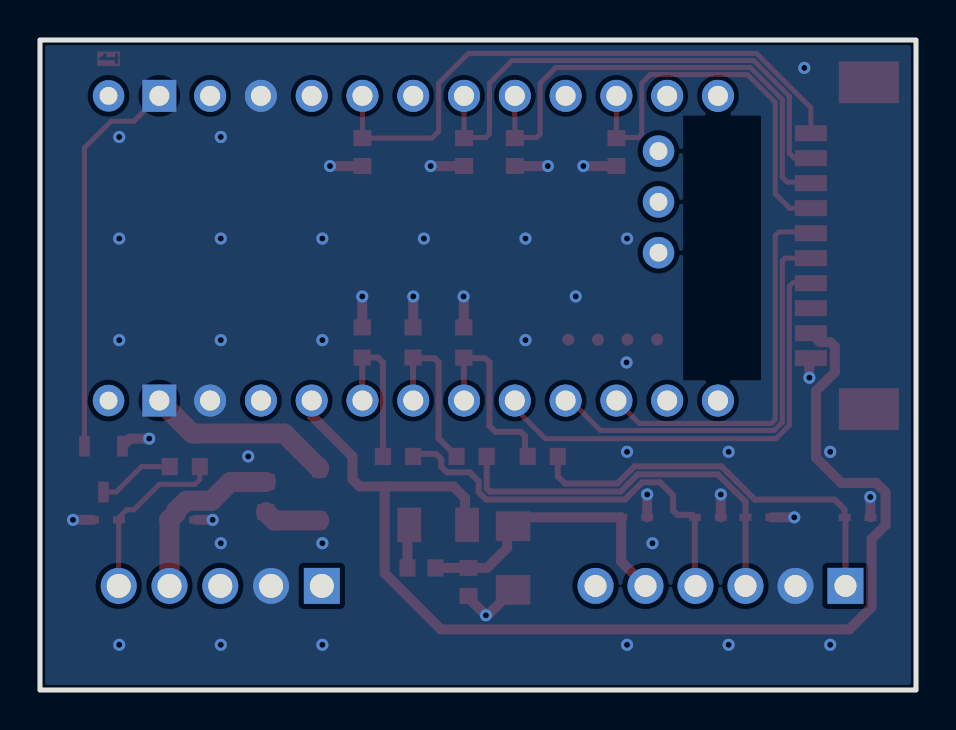
[diagram p5: board, bottom side, seen from below]

Outline 43.81 x 32.51 mm; copper layers: Top Layer, Bottom Layer. Coordinates in mm from the lower left corner of the outline.
Outline path: rectangle 0,32.51 43.81,0
Stack: Top Layer 0.035mm / Dielectric1 1.51mm FR4 er 4.5 / Bottom Layer 0.035mm

## Design rules (mm)
net GND: GND
net BTN_WAKE: Logic IO
net SW_IDLE: Logic IO
net BTN_BLE_DISC: Logic IO
net BTN_CAL_RESET: Logic IO
net 3V3_PED: PWR 3V3
net PEDAL_SOSTENUTO_IN: ADC Analog
net PEDAL_SOFT_IN: ADC Analog
net PEDAL_DAMPER_IN: ADC Analog
net VBUS_5V: PWR 5V
net 3V3_VCC_SW: PWR 3V3
net $2N438: PWR 3V3
net MIDI_TX: Logic IO
net LED_PWR_K: Logic IO
net LED_USB_K: Logic IO
net LED_BLE_K: Logic IO
net MIDI_OUT_5V: PWR 5V
net MIDI_OUT_TX: Logic IO
net VBUS_5V_PROT: PWR 5V
net PEDAL_DAMPER_MK: ADC Analog
net PEDAL_SOFT_MK: ADC Analog
net PEDAL_SOSTENUTO_MK: ADC Analog
net MIDI_TX_UNPROT: Logic IO
template: Custom Config
spacing copperThickness1oz (default): track to track 0.102, other pairs 0.152 to 0.3
spacing copperThickness2oz: track to track 0.203, other pairs 0.152 to 0.3
track width copperThickness1oz (default): min 0.127, default 0.254, max 2.54
track width copperThickness2oz: min 0.203, default 0.254, max 2.54
track width Track_ADC: min 0.25, default 0.3, max 0.5
track width Track_GND: min 0.3, default 0.5, max 1
track width Track_LogicIO: min 0.2, default 0.25, max 0.4
track width Track_PWR_3V3: min 0.3, default 0.5, max 0.8
track width Track_PWR_5V: min 0.6, default 1, max 1.5
differential pair differentialPair (default): width min 0.127, default 0.254, max 2.54; gap min 0.152, default 0.152
via viaSize (default): diameter min 0.5, default 0.61, max 10; hole min 0.3, default 0.305, max 6.3
net class GND uses Track_GND, copperRegionGND
net class Logic IO uses Track_LogicIO
net class PWR 3V3 uses Track_PWR_3V3
net class ADC Analog uses Track_ADC
net class PWR 5V uses Track_PWR_5V
net GND uses Track_GND, copperRegionGND
net BTN_WAKE uses Track_LogicIO
net SW_IDLE uses Track_LogicIO
net BTN_BLE_DISC uses Track_LogicIO
net BTN_CAL_RESET uses Track_LogicIO
net 3V3_PED uses Track_PWR_3V3
net PEDAL_SOSTENUTO_IN uses Track_ADC
net PEDAL_SOFT_IN uses Track_ADC
net PEDAL_DAMPER_IN uses Track_ADC
net VBUS_5V uses Track_PWR_5V
net 3V3_VCC_SW uses Track_PWR_3V3
net $2N438 uses Track_PWR_3V3
net MIDI_TX uses Track_LogicIO
net LED_PWR_K uses Track_LogicIO
net LED_USB_K uses Track_LogicIO
net LED_BLE_K uses Track_LogicIO
net MIDI_OUT_5V uses Track_PWR_5V
net MIDI_OUT_TX uses Track_LogicIO
net VBUS_5V_PROT uses Track_PWR_5V
net PEDAL_DAMPER_MK uses Track_ADC
net PEDAL_SOFT_MK uses Track_ADC
net PEDAL_SOSTENUTO_MK uses Track_ADC
net MIDI_TX_UNPROT uses Track_LogicIO

## Placement (name value [footprint] x y rotation side)
C1  100nF  [C0603]  27.69 26.91 270 top
C2  100nF  [C0603]  22.61 26.91 270 top
C3  100nF  [C0603]  20.07 26.91 90 top
C4  100nF  [C0603]  14.99 26.91 270 top
C5  100nF  [C0603]  22.38 5.41 90 top
C6  22uF  [C1206]  20.15 6.6 90 top
D1  ESD5Z5VU  [SOD-523_L1.2-W0.8-LS1.6-RD]  14.1 8.64 0 top
D2  ESD5Z5VU  [SOD-523_L1.2-W0.8-LS1.6-RD]  10.41 8.64 0 top
D3  ESD5Z5VU  [SOD-523_L1.2-W0.8-LS1.6-RD]  7.88 8.64 0 top
D4  ESD5Z5VU  [SOD-523_L1.2-W0.8-LS1.6-RD]  2.92 8.64 0 top
D5  1N5819WS S4  [SOD-323_L1.6-W1.3-LS2.7-RD]  29.84 9.78 90 top
D6  ESD5Z5VU  [SOD-523_L1.2-W0.8-LS1.6-RD]  36.7 8.51 0 top
D7  ESD5Z5VU  [SOD-523_L1.2-W0.8-LS1.6-RD]  40.51 8.51 180 top
F1  1206L025/16NRT  [F1206]  23.9 8.26 0 top
L1  BLM18AG601SN1D  [L0603]  24.74 6.11 180 top
MCU1  a04b0b1ddfb941d7a6903b0407237df4  [Pro Micro nRF52840]  25.15 22.23 270 top
Q1  DTC114EKAT146  [SOT-346_L2.9-W1.6-P1.90-LS2.8-TR-CW]  40.64 11.05 90 top
R1  4.7kΩ  [R0603]  22.62 17.38 270 top
R2  4.7kΩ  [R0603]  25.16 17.38 270 top
R3  4.7kΩ  [R0603]  27.7 17.38 270 top
R4  1kΩ  [R0603]  25.91 11.68 0 top
R5  1kΩ  [R0603]  22.22 11.68 0 top
R6  1kΩ  [R0603]  18.67 11.68 0 top
R7  220Ω  [R0603]  32.51 9.65 90 top
R8  220Ω  [R0603]  36.58 11.18 180 top
U1  A1251WV-S-10P  [CONN-SMD_10P-P1.25_A1251WV-S-10P]  3.81 22.23 270 top
U2  B6B-XH-A(LF)(SN)  [CONN-TH_6P-P2.50_B6B-XH-A-LF-SN]  9.78 5.21 0 top
U3  B5B-XH-A(LF)(SN)  [CONN-TH_B5B-XH-A-LF-SN]  34.8 5.21 180 top
U4  -  [HDR-TH_12P-P2.54-V-F-3]  23.88 29.72 180 top
U4#2  -  [HDR-TH_12P-P2.54-V-F-3]  23.88 14.48 180 top

## Footprints (pads in the part's own frame, mm; a bottom-side part is the same pattern mirrored in y, then rotated)
C0603
  rect 0.8x0.9 smd: 1(-0.7,0) 2(0.7,0)
C1206
  rect 1.485x1.728 smd: 1(-1.593,0) 2(1.593,0)
CONN-SMD_10P-P1.25_A1251WV-S-10P
  rect 0.8x1.6 smd: 1(-5.625,1.45) 2(-4.375,1.45) 3(-3.125,1.45) 4(-1.875,1.45) 5(-0.625,1.45) 6(0.625,1.45) 7(1.875,1.45) 8(3.125,1.45) 9(4.375,1.45) 10(5.625,1.45)
  rect 2.1x3 smd: 11(8.175,-1.45) 12(-8.175,-1.45)
CONN-TH_6P-P2.50_B6B-XH-A-LF-SN
  rect 1.8x1.8 hole 1.1: 1(-6.251,0.001)
  round 1.8 hole 1.1: 2(-3.749,-0.001) 3(-1.249,-0.001) 4(1.251,-0.001) 5(3.751,-0.001) 6(6.251,-0.001)
CONN-TH_B5B-XH-A-LF-SN
  rect 1.8x1.8 hole 1.2: 1(5.08,0)
  round 1.8 hole 1.2: 2(2.54,0) 3(0,0) 4(-2.54,0) 5(-5.08,0)
F1206
  rect 1.19x1.728 smd: 1(-1.445,0) 2(1.445,0)
HDR-TH_12P-P2.54-V-F-3
  rect 1.7x1.6 hole 1: 2(-13.97,0)
  round 1.6 hole 1: 3(-11.43,0) 4(-8.89,0) 5(-6.35,0) 6(-3.81,0) 7(-1.27,0) 8(1.27,0) 9(3.81,0) 10(6.35,0) 11(8.89,0) 12(11.43,0) 13(13.97,0)
L0603
  rect 0.8x0.864 smd: 1(-0.7,0) 2(0.7,0)
Pro Micro nRF52840
  round 1.575 hole 0.889: 1(-7.493,15.24) 2(-7.493,12.7) 3(-7.493,10.16) 4(-7.493,7.62) 5(-7.493,5.08) 6(-7.493,2.54) 7(-7.493,0) 8(-7.493,-2.54) 9(-7.493,-5.08) 10(-7.493,-7.62) 11(-7.493,-10.16) 12(-7.493,-12.7) 13(-7.493,-15.24) 14(-4.728,-12.267) 15(-2.188,-12.267) 16(0.352,-12.267) 21(7.747,-15.24) 22(7.747,-12.7) 23(7.747,-10.16) 24(7.747,-7.62) 25(7.747,-5.08) 26(7.747,-2.54) 27(7.747,0) 28(7.747,2.54) 29(7.747,5.08) 30(7.747,7.62) 31(7.747,10.16) 32(7.747,12.7) 33(7.747,15.24)
  round 0.6 smd: 17(4.699,-7.757) 18(4.699,-9.237) 19(4.699,-10.717) 20(4.699,-12.197)
R0603
  rect 0.806x0.864 smd: 1(-0.753,0) 2(0.753,0)
SOD-323_L1.6-W1.3-LS2.7-RD
  rect 0.9x0.7 smd: 1(-1.3,0) 2(1.3,0)
SOD-523_L1.2-W0.8-LS1.6-RD
  rect 0.6x0.36 smd: 1(-0.65,0) 2(0.65,0)
SOT-346_L2.9-W1.6-P1.90-LS2.8-TR-CW
  rect 1.045x0.532 smd: 1(1.147,0.95) 2(1.147,-0.95) 3(-1.147,0)

## Nets
As in the schematic.

Pads without a net: MCU1 1 3 5 7 10 12 13 14 15 16 17 18 19 20 21 22 30 33; U1 8 11 12; U2 6; U3 1 3; U4 2 3 4 5 6 7 8 9 10 11 12 13; U4#2 2 3 4 5 6 7 8 9 10 11 12 13

## Via types
v1: diameter 0.61, hole 0.305, Top Layer to Bottom Layer, 44 vias

## Routing (per net, layer and track width the routed paths; a pad name or vN(x,y) marks a point on that pad's centre or on a via; arc(x,y) is an arc through that point)
3V3_PED: length 14.7
  Top Layer w0.5: U2.5 14.75,6.42 D1.2 19.71,8.64 C6.2 20.45,7.9 20.45,7.11 21.45,6.11 C5.2 L1.2
3V3_VCC_SW: length 60.1
  Top Layer w0.5: 22.56,8.25 22.56,9.6 23.14,10.19 26.57,10.19 ; 26.57,10.19 27.83,10.19 28.19,10.54 28.19,11.68 30.22,13.71 30.22,14.47 MCU1.29 ; 26.57,10.19 26.57,5.84 23.76,3.03 3.34,3.03 2.23,4.14 2.23,7.55 1.52,8.26 1.52,9.89 1.99,10.36 3.74,10.36 5,11.62 5,14.96 4.06,15.9 4.06,17.17 4.29,17.4 4.81,17.4 U1.9
GND: length 23.3
  Top Layer w0.5: D6.1 v1(35.18,8.51) ; v1(27.7,19.68) R3.1 ; D4.1 2.29,8.65 v1(2.29,9.65) ; v1(5.33,15.62) 5.33,16.53 U1.10 ; C2.2 v1(24.27,26.21) ; D2.1 v1(9.76,9.78) ; v1(18.41,26.21) 20.07,26.21 ; v1(25.15,19.69) 25.15,18.15 R2.1 ; R1.1 22.62,19.67 v1(22.63,19.68) ; C5.1 22.38,4.61 v1(21.51,3.74) 21.42,3.74 C6.1 ; D7.1 v1(42.16,8.51) ; C1.2 v1(29.31,26.21) ; D3.1 v1(6.09,8.64) ; v1(16.64,26.21) C4.2 ; v1(38.35,12.57) 39.31,12.57 Q1.1 ; D1.1 v1(13.45,9.78)
  vias: v1(4.29,11.91) v1(4.29,2.26) v1(5.59,31.12) v1(9.37,11.91) v1(9.37,2.26) v1(13.18,7.34) v1(14.45,22.58) v1(14.45,11.91) v1(14.45,2.26) v1(14.48,16.38) v1(17.02,19.69) v1(19.53,22.58) v1(19.53,17.5) v1(24.61,22.58) v1(29.69,22.58) v1(29.69,17.5) v1(29.69,7.34) v1(29.69,2.26) v1(33.4,11.68) v1(34.77,27.66) v1(34.77,22.58) v1(34.77,17.5) v1(34.77,7.34) v1(34.77,2.26) v1(39.85,27.66) v1(39.85,22.58) v1(39.85,17.5) v1(39.85,2.26)
VBUS_5V: length 9.4
  Top Layer w1: D5.2 31.59,12.83 36.19,12.83 MCU1.32
VBUS_5V_PROT: length 2.8
  Top Layer w1: D5.1 32.09,8.48 R7.1
BTN_BLE_DISC: length 30.1
  Top Layer w0.25: MCU1.6 C1.1 24.21,27.61 23.88,27.94 23.88,30.35 22.39,31.84 7.97,31.84 5.26,29.13 U1.1
BTN_CAL_RESET: length 24.5
  Top Layer w0.25: MCU1.9 C3.2 20.04,27.64 18.97,27.64 18.8,27.81 18.8,30.35 18.01,31.13 8.28,31.13 6.69,29.54 6.69,25.65 6.44,25.4 5.31,25.4 U1.3
BTN_WAKE: length 20.1
  Top Layer w0.25: U1.4 6.32,24.1 7.04,24.82 7.04,29.39 8.43,30.78 13.29,30.78 13.72,30.35 13.72,27.81 13.89,27.64 14.96,27.64 C4.1 MCU1.11
LED_BLE_K: length 23.1
  Top Layer w0.25: U1.7 5.28,20.37 6.16,20.37 6.34,20.19 6.34,13.24 7.01,12.57 18.54,12.57 20.07,14.1 MCU1.25
LED_PWR_K: length 19.6
  Top Layer w0.25: MCU1.23 13.84,13.34 7.24,13.34 7.04,13.53 7.04,22.73 6.86,22.91 5.32,22.91 U1.5
LED_USB_K: length 21.2
  Top Layer w0.25: U1.6 6.55,21.6 6.69,21.46 6.69,13.39 7.09,12.98 15.78,12.98 17.27,14.48 MCU1.24
MIDI_OUT_5V: length 9
  Top Layer w1: 37.34,5.21 37.34,8.49 D6.2 37,8.86 37,8.96 36.5,9.47 35.24,9.47 34.3,10.41 R7.2
MIDI_OUT_TX: length 8.9
  Top Layer w0.25: R8.2 35.82,10.53 36.07,10.29 37.85,10.29 39.12,9.02 39.48,9.02 39.86,8.64 D7.2 39.88,8.49 U3.5
MIDI_TX: length 19.7
  Top Layer w0.25: Q1.2 41.59,27.12 40.26,28.45 39.12,28.45 MCU1.2
MIDI_TX_UNPROT: length 3.8
  Top Layer w0.25: R8.1 38.73,11.18 40.01,9.9 Q1.3
PEDAL_DAMPER_IN: length 20.6
  Top Layer w0.3: D4.2 3.57,9.03 4.06,9.53 8.07,9.53 9.73,11.19 14.08,11.19 14.94,10.33 17.57,10.33 17.92,10.68 R6.1 ; U2.1 3.53,8.55 ; 3.51,8.57 3.44,8.64
PEDAL_DAMPER_MK: length 9.8
  Top Layer w0.3: R6.2 19.56,11.82 19.56,12.7 19.77,12.91 21.04,12.91 21.34,13.21 21.34,16.38 21.55,16.59 22.58,16.59 R1.2 22.62,14.49 MCU1.26
PEDAL_SOFT_IN: length 19.8
  Top Layer w0.3: U2.3 D3.2 8.53,9.42 9.04,9.93 9.05,9.93 9.91,10.79 13.91,10.79 14.77,9.93 21.34,9.93 21.47,10.06 R5.1
PEDAL_SOFT_MK: length 8.6
  Top Layer w0.3: MCU1.27 25.16,14.49 R2.2 25.12,16.59 24.09,16.59 23.88,16.38 23.88,12.58 R5.2
PEDAL_SOSTENUTO_IN: length 20.6
  Top Layer w0.3: U2.4 11.06,5.24 D2.2 11.19,8.76 11.94,8.76 12.15,8.98 12.15,9.74 12.8,10.39 13.7,10.39 14.56,9.53 21.5,9.53 21.87,9.9 21.87,10.44 22.32,10.89 23.46,10.89 23.75,11.18 23.75,11.56 24,11.81 25.03,11.81 R4.1
PEDAL_SOSTENUTO_MK: length 8
  Top Layer w0.3: R4.2 26.66,16.37 26.91,16.63 R3.2 27.7,14.49 MCU1.28
SW_IDLE: length 26.2
  Top Layer w0.25: MCU1.8 C2.1 22.58,27.64 21.51,27.64 21.34,27.81 21.34,30.35 20.2,31.49 8.12,31.49 6.34,29.7 6.34,26.85 6.09,26.6 U1.2
$2N438: length 1.7
  Top Layer w0.5: L1.1 25.44,7.66 25.34,7.75

## Copper pours and planes (outline as drawn; the poured copper is in the pictures)
GND on Bottom Layer: 0.13,32.39 43.69,32.39 43.69,0.13 0.13,0.13

## Text on the board
Top Layer: 1
